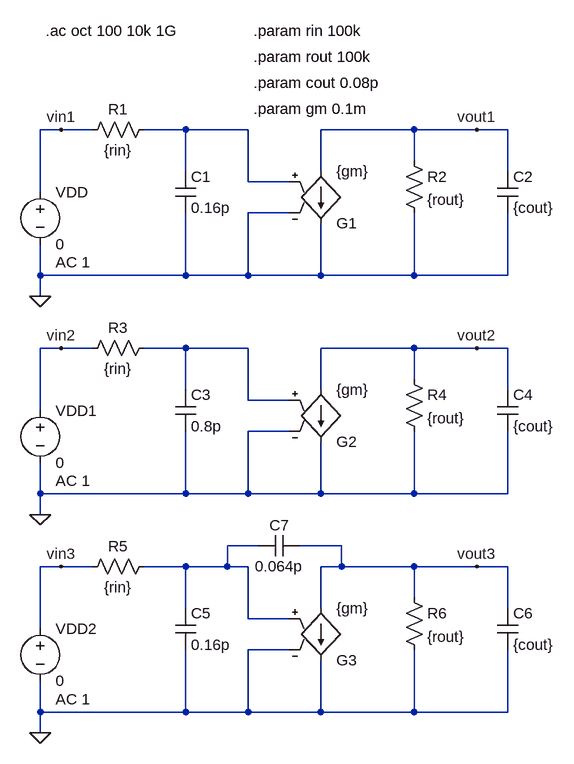
[diagram p0: schematic 3_config_pm.asc]
3_config_pm.asc, the LTspice schematic file:
Version 4
SHEET 1 1092 932
WIRE -1168 -16 -1200 -16
WIRE -1120 -16 -1168 -16
WIRE -976 -16 -1040 -16
WIRE -880 -16 -976 -16
WIRE -624 -16 -768 -16
WIRE -528 -16 -624 -16
WIRE -480 -16 -528 -16
WIRE -624 32 -624 -16
WIRE -976 48 -976 -16
WIRE -768 48 -768 -16
WIRE -480 48 -480 -16
WIRE -880 64 -880 -16
WIRE -816 64 -880 64
WIRE -1200 80 -1200 -16
WIRE -816 112 -880 112
WIRE -1200 208 -1200 160
WIRE -976 208 -976 112
WIRE -976 208 -1200 208
WIRE -880 208 -880 112
WIRE -880 208 -976 208
WIRE -768 208 -768 128
WIRE -768 208 -880 208
WIRE -624 208 -624 112
WIRE -624 208 -768 208
WIRE -480 208 -480 112
WIRE -480 208 -624 208
WIRE -1200 240 -1200 208
WIRE -1168 320 -1200 320
WIRE -1120 320 -1168 320
WIRE -976 320 -1040 320
WIRE -880 320 -976 320
WIRE -624 320 -768 320
WIRE -528 320 -624 320
WIRE -480 320 -528 320
WIRE -624 368 -624 320
WIRE -976 384 -976 320
WIRE -768 384 -768 320
WIRE -480 384 -480 320
WIRE -880 400 -880 320
WIRE -816 400 -880 400
WIRE -1200 416 -1200 320
WIRE -816 448 -880 448
WIRE -1200 544 -1200 496
WIRE -976 544 -976 448
WIRE -976 544 -1200 544
WIRE -880 544 -880 448
WIRE -880 544 -976 544
WIRE -768 544 -768 464
WIRE -768 544 -880 544
WIRE -624 544 -624 448
WIRE -624 544 -768 544
WIRE -480 544 -480 448
WIRE -480 544 -624 544
WIRE -1200 576 -1200 544
WIRE -864 624 -912 624
WIRE -736 624 -800 624
WIRE -1168 656 -1200 656
WIRE -1120 656 -1168 656
WIRE -976 656 -1040 656
WIRE -912 656 -912 624
WIRE -912 656 -976 656
WIRE -880 656 -912 656
WIRE -736 656 -736 624
WIRE -736 656 -768 656
WIRE -624 656 -736 656
WIRE -528 656 -624 656
WIRE -480 656 -528 656
WIRE -624 704 -624 656
WIRE -976 720 -976 656
WIRE -768 720 -768 656
WIRE -480 720 -480 656
WIRE -880 736 -880 656
WIRE -816 736 -880 736
WIRE -1200 752 -1200 656
WIRE -816 784 -880 784
WIRE -1200 880 -1200 832
WIRE -976 880 -976 784
WIRE -976 880 -1200 880
WIRE -880 880 -880 784
WIRE -880 880 -976 880
WIRE -768 880 -768 800
WIRE -768 880 -880 880
WIRE -624 880 -624 784
WIRE -624 880 -768 880
WIRE -480 880 -480 784
WIRE -480 880 -624 880
WIRE -1200 912 -1200 880
FLAG -1200 240 0
FLAG -528 -16 vout1
FLAG -1168 -16 vin1
FLAG -1200 576 0
FLAG -528 320 vout2
FLAG -1168 320 vin2
FLAG -1200 912 0
FLAG -528 656 vout3
FLAG -1168 656 vin3
SYMBOL voltage -1200 64 R0
WINDOW 123 24 124 Left 2
WINDOW 39 0 0 Left 2
SYMATTR Value2 AC 1
SYMATTR InstName VDD
SYMATTR Value 0
SYMBOL res -1024 -32 R90
WINDOW 0 0 56 VBottom 2
WINDOW 3 32 56 VTop 2
SYMATTR InstName R1
SYMATTR Value {rin}
SYMBOL cap -992 48 R0
SYMATTR InstName C1
SYMATTR Value 0.16p
SYMBOL cap -496 48 R0
SYMATTR InstName C2
SYMATTR Value {cout}
SYMBOL res -640 16 R0
SYMATTR InstName R2
SYMATTR Value {rout}
SYMBOL g2 -768 144 M180
SYMATTR InstName G1
SYMATTR Value {gm}
SYMBOL voltage -1200 400 R0
WINDOW 123 24 124 Left 2
WINDOW 39 0 0 Left 2
SYMATTR Value2 AC 1
SYMATTR InstName VDD1
SYMATTR Value 0
SYMBOL res -1024 304 R90
WINDOW 0 0 56 VBottom 2
WINDOW 3 32 56 VTop 2
SYMATTR InstName R3
SYMATTR Value {rin}
SYMBOL cap -992 384 R0
SYMATTR InstName C3
SYMATTR Value 0.8p
SYMBOL cap -496 384 R0
SYMATTR InstName C4
SYMATTR Value {cout}
SYMBOL res -640 352 R0
SYMATTR InstName R4
SYMATTR Value {rout}
SYMBOL g2 -768 480 M180
SYMATTR InstName G2
SYMATTR Value {gm}
SYMBOL voltage -1200 736 R0
WINDOW 123 24 124 Left 2
WINDOW 39 0 0 Left 2
SYMATTR Value2 AC 1
SYMATTR InstName VDD2
SYMATTR Value 0
SYMBOL res -1024 640 R90
WINDOW 0 0 56 VBottom 2
WINDOW 3 32 56 VTop 2
SYMATTR InstName R5
SYMATTR Value {rin}
SYMBOL cap -992 720 R0
SYMATTR InstName C5
SYMATTR Value 0.16p
SYMBOL cap -496 720 R0
SYMATTR InstName C6
SYMATTR Value {cout}
SYMBOL res -640 688 R0
SYMATTR InstName R6
SYMATTR Value {rout}
SYMBOL g2 -768 816 M180
SYMATTR InstName G3
SYMATTR Value {gm}
SYMBOL cap -800 608 R90
WINDOW 0 0 32 VBottom 2
WINDOW 3 32 32 VTop 2
SYMATTR InstName C7
SYMATTR Value 0.064p
TEXT -1192 -168 Left 2 !.ac oct 100 10k 1G
TEXT -872 -168 Left 2 !.param rin 100k
TEXT -872 -128 Left 2 !.param rout 100k
TEXT -872 -88 Left 2 !.param cout 0.08p
TEXT -872 -48 Left 2 !.param gm 0.1m

The netlist it stands for:
* 3_config_pm.asc
VDD vin1 0 0 AC 1
R1 N001 vin1 {rin}
C1 N001 0 0.16p
C2 vout1 0 {cout}
R2 vout1 0 {rout}
G1 vout1 0 N001 0 {gm}
VDD1 vin2 0 0 AC 1
R3 N002 vin2 {rin}
C3 N002 0 0.8p
C4 vout2 0 {cout}
R4 vout2 0 {rout}
G2 vout2 0 N002 0 {gm}
VDD2 vin3 0 0 AC 1
R5 N003 vin3 {rin}
C5 N003 0 0.16p
C6 vout3 0 {cout}
R6 vout3 0 {rout}
G3 vout3 0 N003 0 {gm}
C7 vout3 N003 0.064p
.ac oct 100 10k 1G
.param rin 100k
.param rout 100k
.param cout 0.08p
.param gm 0.1m
.backanno
.end